# EasyEDA Pro project TM4C123（改）.eprj

# Schematic TM4C核心板
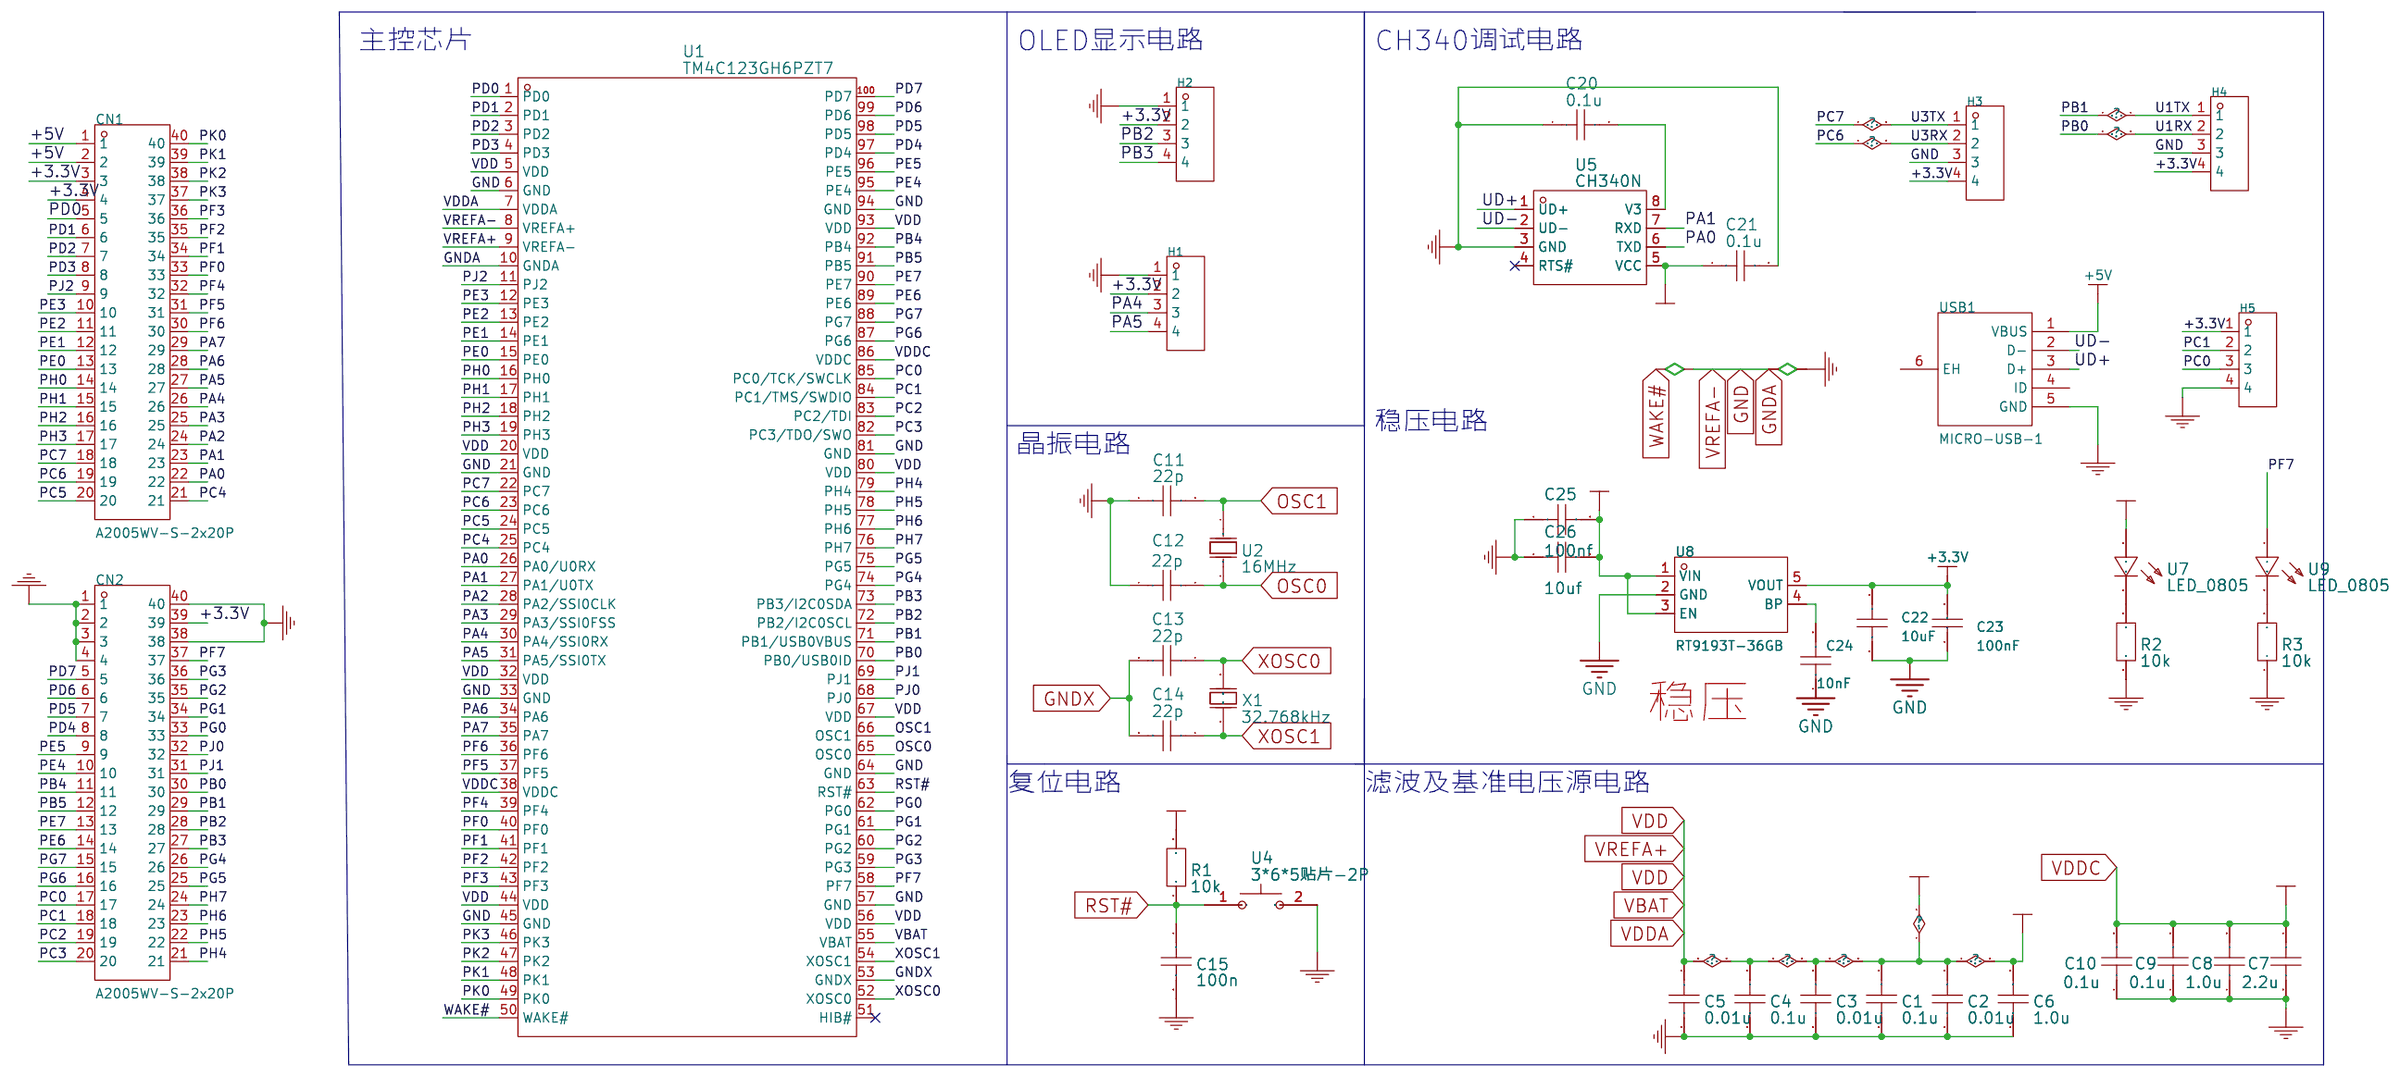
[diagram p0: schematic sheet]

## Parts
C1  0.1u  [C0603]
C2  0.01u  [C0603]
C3  0.01u  [C0603]
C4  0.1u  [C0603]
C5  0.01u  [C0603]
C6  1.0u  [C0603]
C7  2.2u  [C0603]
C8  1.0u  [C0603]
C9  0.1u  [C0603]
C10  0.1u  [C0603]
C11  22p  [C0603]
C12  22p  [C0603]
C13  22p  [C0603]
C14  22p  [C0603]
C15  100n  [C0603]
C20  0.1u  [C0603]
C21  0.1u  [C0603]
C22  10uF  [C0603]
C23  100nF  [C0603]
C24  10nF  [C0603]
C25  100nf  [C0603]
C26  10uf  [C0603]
CN1  A2005WV-S-2x20P  [HDR-TH_40P-P2.54-V-M-R2-C20-S2.54]
CN2  A2005WV-S-2x20P  [HDR-TH_40P-P2.54-V-M-R2-C20-S2.54]
H1  -  [HDR-TH_4P-P2.54-V-F]
H2  -  [HDR-TH_4P-P2.54-V-F]
H3  -  [HDR-TH_4P-P2.54-V-F]
H4  -  [HDR-TH_4P-P2.54-V-F]
H5  -  [HDR-TH_4P-P2.54-V-F]
R1  10k  [R0603]
R2  10k  [R0603]
R3  10k  [R0603]
U1  TM4C123GH6PZT7  [LQFP-100_L14.0-W14.0-P0.50-LS16.0-TL]
U2  16MHz  [CRYSTAL_SMD_5032-2PIN_5.0X3.2MM]
U4  3*6*5贴片-2P  [SW-SMD_L6.0-W3.5-LS8.0]
U5  CH340N  [CH340N]
U7  LED_0805  [LED0603-RD_BLUE]
U8  RT9193T-36GB  [TSOT-23-5_L2.9-W1.6-P0.95-LS2.8-BL]
U9  LED_0805  [LED0603-RD_BLUE]
USB1  MICRO-USB-1  [MICRO-USB-SMD_C9900008946]
X1  32.768kHz  [OSC-SMD_2P-L3.2-W1.5-1]

## Library data of the parts
C1 C4 C9 C10 C20 C21 = 0.1u: link: https://item.szlcsc.com/373011.html; 3DModel: C0805_L2.0-W1.3-H1.3
C2 C3 C5 = 0.01u: link: https://item.szlcsc.com/373011.html; 3DModel: C0805_L2.0-W1.3-H1.3
C6 C8 = 1.0u: link: https://item.szlcsc.com/373011.html; 3DModel: C0805_L2.0-W1.3-H1.3
C7 = 2.2u: link: https://item.szlcsc.com/373011.html; 3DModel: C0805_L2.0-W1.3-H1.3
C11-C14 = 22p: link: https://item.szlcsc.com/373011.html; 3DModel: C0805_L2.0-W1.3-H1.3
C15 = 100n: link: https://item.szlcsc.com/373011.html; 3DModel: C0805_L2.0-W1.3-H1.3
C22 C24 = CL10A106KP8NNNC: 容值:10uF;精度:±10%;额定电压:10V;材质(温度系数):X5R;; LCSC Part Name: 10uF ±10% 10V; Supplier Part: C19702; Manufacturer: SAMSUNG(三星); Supplier Footprint: 0603; JLCPCB Part Class: 基础库; Datasheet: https://atta.szlcsc.com/upload/public/pdf/source/20160103/1457707703378.pdf; Supplier: LCSC; Tolerance: ±10%; Voltage Rated: 10V; Temperature Coefficient: X5R
C23 = 0603B104K500NT: 容值:100nF;精度:±10%;额定电压:50V;材质(温度系数):X7R;; LCSC Part Name: 100nF ±10% 50V; Supplier Part: C30926; Manufacturer: FH(风华); Supplier Footprint: 0603; JLCPCB Part Class: 扩展库; Datasheet: https://atta.szlcsc.com/upload/public/pdf/source/20170923/C30926_1506149436298988724.pdf; Supplier: LCSC; Tolerance: ±10%; Voltage Rated: 50V; Temperature Coefficient: X7R
C25 = 100nf: link: https://item.szlcsc.com/373011.html; 3DModel: C0805_L2.0-W1.3-H1.3
C26 = 10uf: link: https://item.szlcsc.com/373011.html; 3DModel: C0805_L2.0-W1.3-H1.3
CN1 CN2 = A2005WV-S-2x20P: Supplier Part: C9900019710; Supplier Footprint: SMD-40P; JLCPCB Part Class: 扩展库; Supplier: LCSC
H1-H5 = HDR-F_2.54_1x4P: Supplier Part: C2718488; Supplier Footprint: 插件
R1-R3 = 10k: link: https://item.szlcsc.com/142685.html; 3DModel: R0805_L2.0-W1.3-H0.6
U1 = TM4C123GH6PZT7: link: https://atta.szlcsc.comnull; Supplier: LCSC; Supplier Part: C2863116; Manufacturer: TI(德州仪器)
U2 = 16MHz: license: https://www.gnu.org/licenses/lgpl-2.1.html; Supplier: LCSC; Supplier Part: C2450749; Manufacturer: ECS; Manufacturer Part: ECS-160-18-30-JGN-TR; JLCPCB Part Class: Extended Part
U4 = 3*6*5贴片-2P: link: https://item.szlcsc.com/300333.html; 3DModel: SW-SMD_L6.0-W3.5-H5.0-P7.5-LS8.0; Supplier: LCSC; Supplier Part: C9900011307; Manufacturer: null; JLCPCB Part Class: Extended Part
U5 = CH340N: Supplier: LCSC; Supplier Part: C506813; Manufacturer: WCH(Jiangsu Qin Heng); Paste Type: expand
U7 U9 = LED_0805: link: https://atta.szlcsc.com/upload/public/pdf/source/20181204/C264418_73B9BB56B6270D5E5A61DA675CE1A050.pdf; 3DModel: LED0805-R-RD_GREEN; Supplier: LCSC; Supplier Part: C9900014946; Manufacturer: null; JLCPCB Part Class: Extended Part
U8 = RT9193T-36GB: Supplier Part: C2926026; Supplier Footprint: TSOT-23-5; JLCPCB Part Class: 扩展库; Supplier: LCSC
USB1 = MICRO-USB-1: Supplier Part: C9900008946; Supplier Footprint: USB-micro; JLCPCB Part Class: 扩展库; Supplier: LCSC
X1 = 32.768kHz: link: https://atta.szlcsc.com/upload/public/pdf/source/20201023/C909615_5CB83FDF197FE73AFEAD0F20FB1E7116.pdf; Supplier: LCSC; Supplier Part: C130253; Manufacturer: ABRACON; Manufacturer Part: ABS07-32.768KHZ-T; JLCPCB Part Class: Extended Part

## Nets
+3.3V: C1.2 C2.2 C3.2 C4.2 C5.1 C6.2 C22.2 C23.2 CN1.3 CN1.4 CN2.39 H1.2 H2.2 H3.4 H4.4 H5.1 R1.2 U1.5(VDD) U1.7(VDDA) U1.9(VREFA-) U1.20(VDD) U1.32(VDD) U1.44(VDD) U1.55(VBAT) U1.56(VDD) U1.67(VDD) U1.80(VDD) U1.93(VDD) U7.1(A) U8.5(VOUT)
+5V: C21.1 C25.2 C26.2 CN1.1 CN1.2 U5.5(VCC) U8.1(VIN) U8.3(EN) USB1.1(VBUS)
GND: C1.1 C2.1 C3.1 C4.1 C5.2 C6.1 C7.2 C8.1 C9.1 C10.1 C11.1 C12.1 C15.2 C20.1 C21.2 C22.1 C23.1 C24.1 C25.1 C26.1 CN2.1 CN2.2 CN2.3 CN2.4 CN2.38 CN2.40 H1.1 H2.1 H3.3 H4.3 H5.4 R2.1 R3.1 U1.6(GND) U1.8(VREFA+) U1.10(GNDA) U1.21(GND) U1.33(GND) U1.45(GND) U1.50(WAKE#) U1.57(GND) U1.64(GND) U1.81(GND) U1.94(GND) U4.2 U5.3(GND) U8.2(GND) USB1.5(GND)
GNDX: C13.2 C14.2 U1.53(GNDX)
+MCU_VDDC: C7.1 C8.2 C9.2 C10.2 U1.38(VDDC) U1.86(VDDC)
OSC0: C12.2 U1.65(OSC0) U2.2(OSC2)
OSC1: C11.2 U1.66(OSC1) U2.1(OSC1)
PA0: CN1.22 U1.26(PA0/U0RX) U5.6(TXD)
PA1: CN1.23 U1.27(PA1/U0TX) U5.7(RXD)
PA2: CN1.24 U1.28(PA2/SSI0CLK)
PA3: CN1.25 U1.29(PA3/SSI0FSS)
PA4: CN1.26 H1.3 U1.30(PA4/SSI0RX)
PA5: CN1.27 H1.4 U1.31(PA5/SSI0TX)
PA6: CN1.28 U1.34(PA6)
PA7: CN1.29 U1.35(PA7)
PB0: CN2.30 H4.2 U1.70(PB0/USB0ID)
PB1: CN2.29 H4.1 U1.71(PB1/USB0VBUS)
PB2: CN2.28 H2.3 U1.72(PB2/I2C0SCL)
PB3: CN2.27 H2.4 U1.73(PB3/I2C0SDA)
PB4: CN2.11 U1.92(PB4)
PB5: CN2.12 U1.91(PB5)
PC0: CN2.17 H5.3 U1.85(PC0/TCK/SWCLK)
PC1: CN2.18 H5.2 U1.84(PC1/TMS/SWDIO)
PC2: CN2.19 U1.83(PC2/TDI)
PC3: CN2.20 U1.82(PC3/TDO/SWO)
PC4: CN1.21 U1.25(PC4)
PC5: CN1.20 U1.24(PC5)
PC6: CN1.19 H3.2 U1.23(PC6)
PC7: CN1.18 H3.1 U1.22(PC7)
PD0: CN1.5 U1.1(PD0)
PD1: CN1.6 U1.2(PD1)
PD2: CN1.7 U1.3(PD2)
PD3: CN1.8 U1.4(PD3)
PD4: CN2.8 U1.97(PD4)
PD5: CN2.7 U1.98(PD5)
PD6: CN2.6 U1.99(PD6)
PD7: CN2.5 U1.100(PD7)
PE0: CN1.13 U1.15(PE0)
PE1: CN1.12 U1.14(PE1)
PE2: CN1.11 U1.13(PE2)
PE3: CN1.10 U1.12(PE3)
PE4: CN2.10 U1.95(PE4)
PE5: CN2.9 U1.96(PE5)
PE6: CN2.14 U1.89(PE6)
PE7: CN2.13 U1.90(PE7)
PF0: CN1.33 U1.40(PF0)
PF1: CN1.34 U1.41(PF1)
PF2: CN1.35 U1.42(PF2)
PF3: CN1.36 U1.43(PF3)
PF4: CN1.32 U1.39(PF4)
PF5: CN1.31 U1.37(PF5)
PF6: CN1.30 U1.36(PF6)
PF7: CN2.37 U1.58(PF7) U9.1(A)
PG0: CN2.33 U1.62(PG0)
PG1: CN2.34 U1.61(PG1)
PG2: CN2.35 U1.60(PG2)
PG3: CN2.36 U1.59(PG3)
PG4: CN2.26 U1.74(PG4)
PG5: CN2.25 U1.75(PG5)
PG6: CN2.16 U1.87(PG6)
PG7: CN2.15 U1.88(PG7)
PH0: CN1.14 U1.16(PH0)
PH1: CN1.15 U1.17(PH1)
PH2: CN1.16 U1.18(PH2)
PH3: CN1.17 U1.19(PH3)
PH4: CN2.21 U1.79(PH4)
PH5: CN2.22 U1.78(PH5)
PH6: CN2.23 U1.77(PH6)
PH7: CN2.24 U1.76(PH7)
PJ0: CN2.32 U1.68(PJ0)
PJ1: CN2.31 U1.69(PJ1)
PJ2: CN1.9 U1.11(PJ2)
PK0: CN1.40 U1.49(PK0)
PK1: CN1.39 U1.48(PK1)
PK2: CN1.38 U1.47(PK2)
PK3: CN1.37 U1.46(PK3)
RST#: C15.1 R1.1 U1.63(RST#) U4.1
UD+: U5.1(UD+) USB1.3(D+)
UD-: U5.2(UD-) USB1.2(D-)
XOSC0: C13.1 U1.52(XOSC0) X1.2(OSC2)
XOSC1: C14.1 U1.54(XOSC1) X1.1(OSC1)
$1N922: C20.2 U5.8(V3)
$1N1167: R2.2 U7.2(C)
$1N2381: C24.2 U8.4(BP)
$1N8327: R3.2 U9.2(C)

Not connected (* = marked no-connect by the designer): U1 51(HIB#)*; U5 4(RTS#)*; USB1 4(ID) 6(EH)

## Notes on the sheet
- 主控芯片
- OLED显示电路
- CH340调试电路
- 稳压电路
- 晶振电路
- 稳压
- 复位电路
- 滤波及基准电压源电路

# Board PCB_PCB_TM4C核心板-copy_2024-06-06
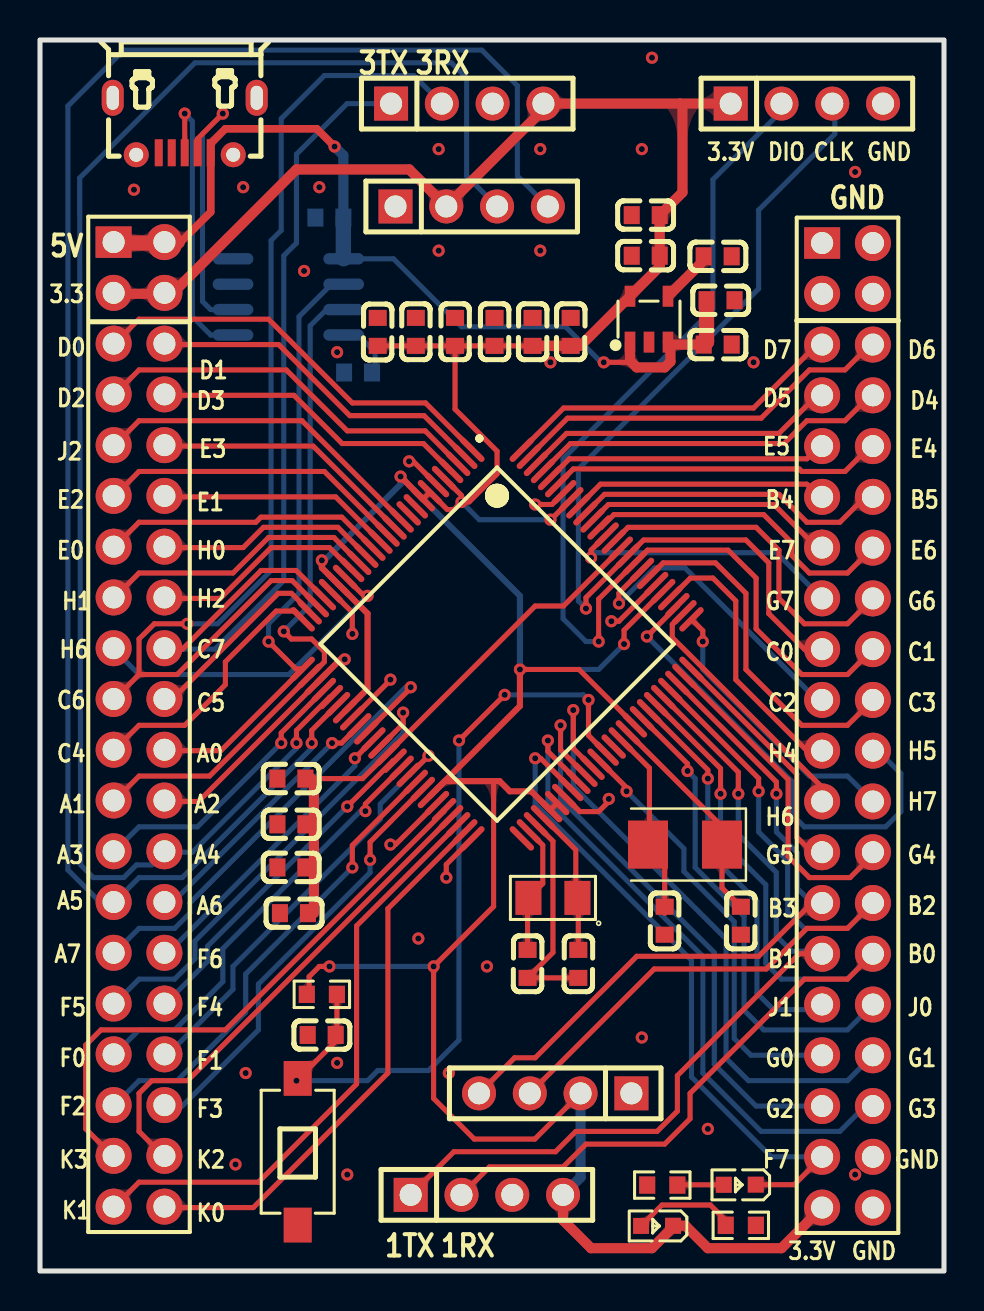
[diagram p1: board, top side]
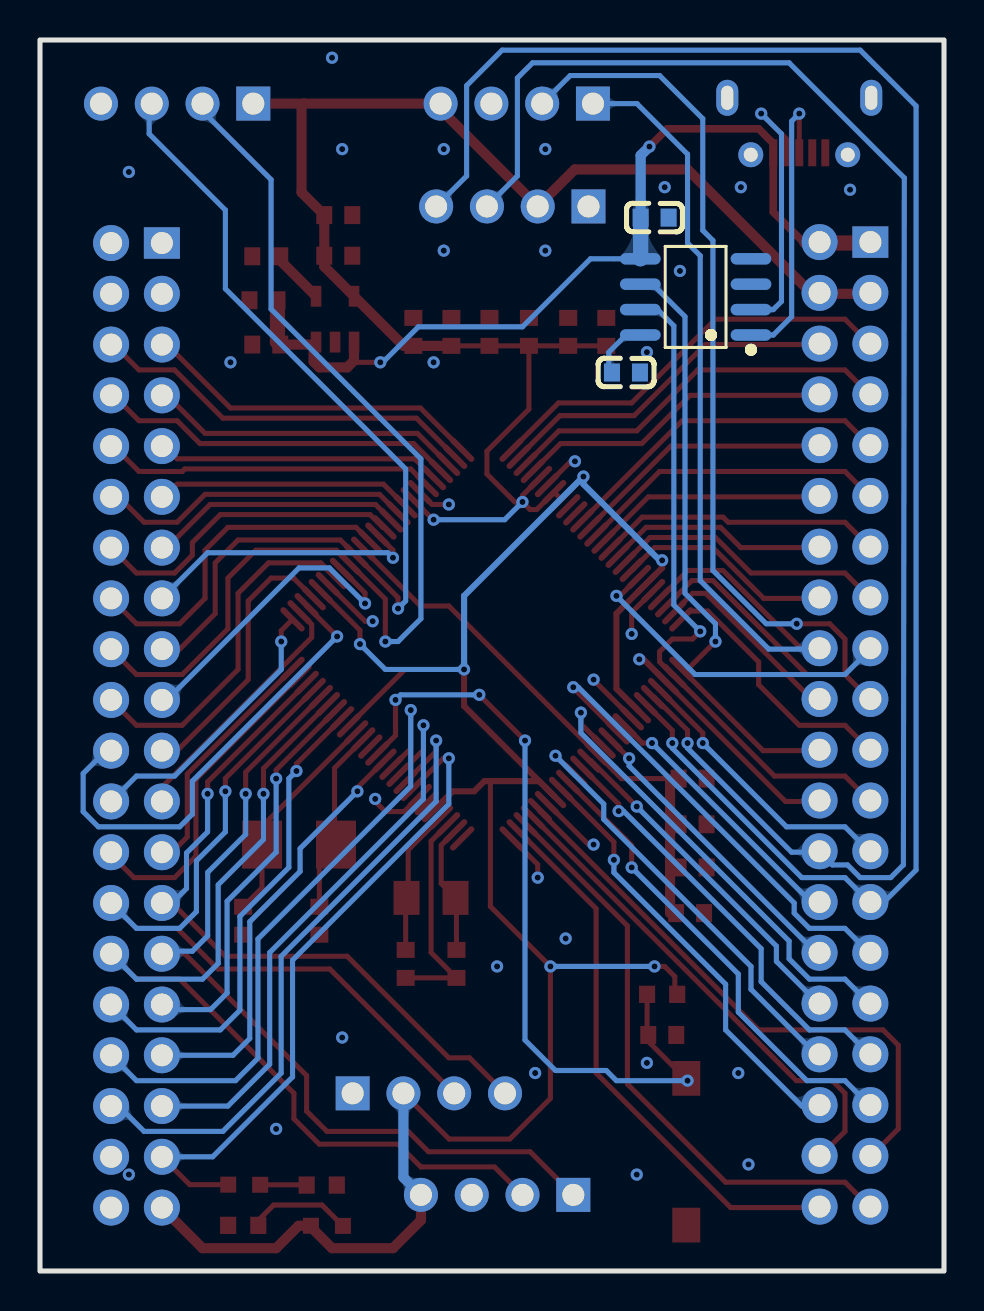
[diagram p2: board, bottom side, seen from below]

Outline 45.21 x 61.6 mm; copper layers: Top Layer, Bottom Layer. Coordinates in mm from the lower left corner of the outline.
Outline path: rectangle 0,61.6 45.21,0
Stack: Top Layer 0.035mm / Dielectric1 1.51mm FR4 er 4.5 / Bottom Layer 0.035mm

## Design rules (mm)
template: 用户自定义配置
spacing Default (default): track to track 0.127, other pairs 0 to 0.152
track width Default (default): min 0.254, default 0.254, max 25.4
differential pair differentialPair (default): width min 0.127, default 0.254, max 2.54; gap min 0.152, default 0.152
via Default (default): diameter min 0.61, default 0.61, max 100.025; hole min 0.305, default 0.305, max 59.995
net GND uses gge34936

## Placement (name value [footprint] x y rotation side)
C1  0.1u  [C0603]  22.73 46.99 270 top
C2  0.01u  [C0603]  24.64 46.99 270 top
C3  0.01u  [C0603]  20.76 46.99 270 top
C4  0.1u  [C0603]  18.8 46.99 270 top
C5  0.01u  [C0603]  16.89 46.99 90 top
C6  1.0u  [C0603]  26.54 46.99 270 top
C7  2.2u  [C0603]  12.7 17.91 180 top
C8  1.0u  [C0603]  12.57 20.19 0 top
C9  0.1u  [C0603]  12.57 22.35 0 top
C10  0.1u  [C0603]  12.57 24.64 0 top
C11  22p  [C0603]  35.05 17.53 90 top
C12  22p  [C0603]  31.24 17.53 90 top
C13  22p  [C0603]  24.38 15.37 270 top
C14  22p  [C0603]  26.92 15.37 270 top
C15  100n  [C0603]  14.09 11.81 180 top
C20  0.1u  [C0603]  15.91 44.96 0 bottom
C21  0.1u  [C0603]  14.47 52.71 180 bottom
C22  10uF  [C0603]  30.29 50.8 0 top
C23  100nF  [C0603]  30.29 52.83 0 top
C24  10nF  [C0603]  33.89 50.77 180 top
C25  100nf  [C0603]  34.04 48.57 180 top
C26  10uf  [C0603]  33.89 46.36 180 top
CN1  A2005WV-S-2x20P  [HDR-TH_40P-P2.54-V-M-R2-C20-S2.54]  4.95 27.35 270 top
CN2  A2005WV-S-2x20P  [HDR-TH_40P-P2.54-V-M-R2-C20-S2.54]  40.39 27.31 270 top
H1  -  [HDR-TH_4P-P2.54-V-F]  21.59 53.27 0 top
H2  -  [HDR-TH_4P-P2.54-V-F]  25.77 8.89 180 top
H3  -  [HDR-TH_4P-P2.54-V-F]  21.37 58.41 0 top
H4  -  [HDR-TH_4P-P2.54-V-F]  22.35 3.81 0 top
H5  -  [HDR-TH_4P-P2.54-V-F]  38.35 58.41 0 top
R1  10k  [R0603]  14.1 13.84 180 top
R2  10k  [R0603]  35.05 2.29 180 top
R3  10k  [R0603]  31.12 4.3 0 top
U1  TM4C123GH6PZT7  [LQFP-100_L14.0-W14.0-P0.50-LS16.0-TL]  22.86 31.37 315 top
U2  16MHz  [CRYSTAL_SMD_5032-2PIN_5.0X3.2MM]  32.26 21.34 180 top
U4  3*6*5贴片-2P  [SW-SMD_L6.0-W3.5-LS8.0]  12.89 5.97 270 top
U5  -  [CH340N]  10.29 50.52 90 bottom
U7  LED_0805  [LED0603-RD_BLUE]  30.86 2.26 180 top
U8  RT9193T-36GB  [TSOT-23-5_L2.9-W1.6-P0.95-LS2.8-BL]  30.46 47.62 0 top
U9  LED_0805  [LED0603-RD_BLUE]  35 4.32 180 top
USB1  MICRO-USB-1  [MICRO-USB-SMD_C9900008946]  7.24 57.28 180 top
X1  32.768kHz  [OSC-SMD_2P-L3.2-W1.5-1]  25.65 18.67 180 top

## Footprints (pads in the part's own frame, mm; a bottom-side part is the same pattern mirrored in y, then rotated)
C0603
  rect 0.8x0.9 smd: 1(-0.7,0) 2(0.7,0)
CH340N
  oval 0.574x2.035 smd: 1(-3.683,-0.633) 2(-2.413,-0.633) 3(-1.143,-0.633) 4(0.128,-0.633) 5(0.128,4.902) 6(-1.143,4.902) 7(-2.413,4.902) 8(-3.683,4.902)
CRYSTAL_SMD_5032-2PIN_5.0X3.2MM
  rect 2x2.4 smd: 1(-1.85,0) 2(1.85,0)
HDR-TH_4P-P2.54-V-F
  rect 1.7x1.7 hole 1.1: 1(-3.81,0)
  round 1.7 hole 1.1: 2(-1.27,0) 3(1.27,0) 4(3.81,0)
HDR-TH_40P-P2.54-V-M-R2-C20-S2.54
  rect 1.575x1.8 hole 1.1: 1(-24.13,-1.27)
  round 1.8 hole 1.1: 2(-24.13,1.27) 3(-21.59,-1.27) 4(-21.59,1.27) 5(-19.05,-1.27) 6(-19.05,1.27) 7(-16.51,-1.27) 8(-16.51,1.27) 9(-13.97,-1.27) 10(-13.97,1.27) 11(-11.43,-1.27) 12(-11.43,1.27) 13(-8.89,-1.27) 14(-8.89,1.27) 15(-6.35,-1.27) 16(-6.35,1.27) 17(-3.81,-1.27) 18(-3.81,1.27) 19(-1.27,-1.27) 20(-1.27,1.27) 21(1.27,-1.27) 22(1.27,1.27) 23(3.81,-1.27) 24(3.81,1.27) 25(6.35,-1.27) 26(6.35,1.27) 27(8.89,-1.27) 28(8.89,1.27) 29(11.43,-1.27) 30(11.43,1.27) 31(13.97,-1.27) 32(13.97,1.27) 33(16.51,-1.27) 34(16.51,1.27) 35(19.05,-1.27) 36(19.05,1.27) 37(21.59,-1.27) 38(21.59,1.27) 39(24.13,-1.27) 40(24.13,1.27)
LED0603-RD_BLUE
  rect 0.8x0.8 smd: 1(-0.799,-0.004) 2(0.799,0.004)
LQFP-100_L14.0-W14.0-P0.50-LS16.0-TL
  oval 1.6x0.3 smd: 1(-7.75,6) 2(-7.75,5.5) 3(-7.75,5) 4(-7.75,4.5) 5(-7.75,4) 6(-7.75,3.5) 7(-7.75,3) 8(-7.75,2.501) 9(-7.75,2) 10(-7.75,1.5) 11(-7.75,1) 12(-7.75,0.5) 13(-7.75,0) 14(-7.75,-0.5) 15(-7.75,-1) 16(-7.75,-1.5) 17(-7.75,-2) 18(-7.75,-2.501) 19(-7.75,-3) 20(-7.75,-3.5) 21(-7.75,-4) 22(-7.75,-4.5) 23(-7.75,-5) 24(-7.75,-5.5) 25(-7.75,-6) 51(7.75,-6) 52(7.75,-5.5) 53(7.75,-5) 54(7.75,-4.5) 55(7.75,-4) 56(7.75,-3.5) 57(7.75,-3) 58(7.75,-2.501) 59(7.75,-2) 60(7.75,-1.5) 61(7.75,-1) 62(7.75,-0.5) 63(7.75,0) 64(7.75,0.5) 65(7.75,1) 66(7.75,1.5) 67(7.75,2) 68(7.75,2.5) 69(7.75,3) 70(7.75,3.5) 71(7.75,4) 72(7.75,4.5) 73(7.75,5) 74(7.75,5.5) 75(7.75,6)
  oval 0.3x1.6 smd: 26(-6,-7.75) 27(-5.5,-7.75) 28(-5,-7.75) 29(-4.5,-7.75) 30(-4,-7.75) 31(-3.5,-7.75) 32(-3,-7.75) 33(-2.5,-7.75) 34(-2,-7.75) 35(-1.5,-7.75) 36(-1,-7.75) 37(-0.5,-7.75) 38(0,-7.75) 39(0.5,-7.75) 40(1,-7.75) 41(1.5,-7.75) 42(2,-7.75) 43(2.501,-7.75) 44(3,-7.75) 45(3.5,-7.75) 46(4,-7.75) 47(4.5,-7.75) 48(5,-7.75) 49(5.5,-7.75) 50(6,-7.75) 76(6,7.75) 77(5.5,7.75) 78(5,7.75) 79(4.5,7.75) 80(4,7.75) 81(3.5,7.75) 82(3,7.75) 83(2.501,7.75) 84(2,7.75) 85(1.5,7.75) 86(1,7.75) 87(0.5,7.75) 88(0,7.75) 89(-0.5,7.75) 90(-1,7.75) 91(-1.5,7.75) 92(-2,7.75) 93(-2.501,7.75) 94(-3,7.75) 95(-3.5,7.75) 96(-4,7.75) 97(-4.5,7.75) 98(-5,7.75) 99(-5.5,7.75) 100(-6,7.75)
MICRO-USB-SMD_C9900008946
  rect 0.4x1.35 smd: 1(-1.3,1.325) 2(-0.65,1.325) 3(0,1.325) 4(0.65,1.325) 5(1.3,1.325)
  oval 1.1x1.8 hole 0.6x1.2: 6(-3.6,-1.425) 6(3.6,-1.425)
  round 1.25 hole 0.7: 6(-2.425,1.425) 6(2.425,1.425)
OSC-SMD_2P-L3.2-W1.5-1
  rect 1.3x1.7 smd: 1(-1.225,0) 2(1.225,0)
R0603
  rect 0.806x0.864 smd: 1(-0.753,0) 2(0.753,0)
SW-SMD_L6.0-W3.5-LS8.0
  rect 1.74x1.4 smd: 1(-3.67,0) 2(3.67,0)
TSOT-23-5_L2.9-W1.6-P0.95-LS2.8-BL
  rect 0.532x1.045 smd: 1(-0.95,-1.147) 2(0,-1.147) 3(0.95,-1.147) 4(0.95,1.147) 5(-0.95,1.147)

## Nets
As in the schematic, except:
+3.3V: C1.2 C2.2 C3.2 C4.2 C5.1 C6.2 C22.2 C23.2 CN1.3 CN1.4 CN2.39 H1.2 H2.2 H3.4 H4.4 H5.1 R1.2 U1.5 U1.7 U1.8 U1.20 U1.32 U1.44 U1.55 U1.56 U1.67 U1.80 U1.93 U7.1 U8.5
GND: C1.1 C2.1 C3.1 C4.1 C5.2 C6.1 C7.2 C8.1 C9.1 C10.1 C11.1 C12.1 C15.2 C20.1 C21.2 C22.1 C23.1 C24.1 C25.1 C26.1 CN2.1 CN2.2 CN2.3 CN2.4 CN2.38 CN2.40 H1.1 H2.1 H3.3 H4.3 H5.4 R2.1 R3.1 U1.6 U1.9 U1.10 U1.21 U1.33 U1.45 U1.50 U1.57 U1.64 U1.81 U1.94 U4.2 U5.3 U8.2 USB1.5
VDDC: C7.1 C8.2 C9.2 C10.2 U1.38 U1.86

Pads without a net: U1 51; U5 4; USB1 4 6

## Via types
v1: diameter 0.61, hole 0.306, Top Layer to Bottom Layer, 22 vias
v2: diameter 0.61, hole 0.305, Top Layer to Bottom Layer, 60 vias

## Routing (per net, layer and track width the routed paths; a pad name or vN(x,y) marks a point on that pad's centre or on a via; arc(x,y) is an arc through that point)
+3.3V: length 197
  Top Layer w0.254: v2(21.08,38.48) 21.46,38.48 22.86,39.88 22.86,41.02 20.76,43.12 C3.2 ; v2(21.08,38.48) 20.7,38.1 20.37,38.1 U1.7 19.15,38.62 ; v2(21.08,38.48) 21.08,38.8 U1.5 ; C3.2 C4.2 C5.1 ; C3.2 C1.2 C2.2 ; v2(24,30.1) 26.96,30.1 29.75,27.3 ; v2(25.53,37.59) 25.55,37.59 26.57,38.62 ; R1.2 13.46,13.96 13.46,14.73 13.97,15.24 v2(14.48,15.24) ; U1.80 29.21,32.06 v2(29.21,31.37) ; 22.69,24.51 22.69,18.24 v2(19.69,15.24) 19.69,8.64 21.72,6.6 24.75,6.6 H2.2 ; 25.87,23.41 25.51,23.06
  Top Layer w0.305: 19.15,38.62 v2(18.03,39.75) ; 25.51,23.06 24.57,24 23.5,24 22.99,24.51 20.24,24.51 U1.44 24,28.27 v2(24,30.1) ; v2(14.1,35.56) 14.1,35.18 16.38,32.9 16.38,29.13 15.26,28.01
  Top Layer w0.508: 3.68,48.9 6.6,48.9 12.83,55.12 18.47,55.12 20.32,53.27 25.18,58.12 H3.4 32,58.41 ; CN2.39 37.08,1.14 33.4,1.14 32.28,2.26 U7.1 31.66,2.2 30.61,1.14 27.56,1.14 26.16,2.54 H4.4 ; 32,58.41 H5.1 ; 32,58.41 32.13,58.28 32.13,53.97 C23.2 C22.2 30.99,50.26 U8.5 27.02,46.29 C6.2 C2.2
  Bottom Layer w0.254: v2(21.08,38.48) 21.97,37.59 v2(25.53,37.59) ; v2(14.48,15.24) v2(19.69,15.24) ; v2(29.21,31.37) 27.94,30.1 v2(24,30.1)
  Bottom Layer w0.305: v2(24,30.1) 24,33.78 v2(18.03,39.75) 18.03,39.37 14.22,35.56 v2(14.1,35.56)
  Bottom Layer w0.508: H4.4 27.04,4.69 H2.2
+5V: length 46.3
  Top Layer w0.254: v2(28.19,45.47) 29.42,45.47 29.51,45.55
  Top Layer w0.381: v2(14.73,56.26) 13.84,57.15 9.27,57.15 8.54,56.42 8.54,52.99 6.99,51.44
  Top Layer w0.508: U8.1 29.51,45.55 29.84,45.21 31.24,45.21 31.53,45.5 31.53,46.36 ; 6.22,51.44 6.99,51.44 ; C26.2 31.53,46.36 ; 31.53,46.36 U8.3
  Top Layer w0.762: C26.2 33.34,46.5 C25.2 ; 3.68,51.44 6.22,51.44
  Bottom Layer w0.254: v2(28.19,45.47) 28.07,45.47 26.29,47.24 21.08,47.24 17.68,50.64 U5.5
  Bottom Layer w0.508: v2(14.73,56.26) 15.17,55.82 C21.1
  Bottom Layer w0.762: C21.1 15.17,50.66 U5.5
GND: length 20.7
  Top Layer w0.254: 18.29,40.51 18.67,40.51 19.86,39.32 ; v2(15.62,31.88) 15.62,32.95 U1.21 ; 15.61,27.66 17.53,29.57 v2(17.53,29.59) ; 19.86,23.41 17.78,21.34 v2(17.53,21.34) ; 30.82,34.37 28.95,32.51 v2(28.58,32.51) ; v2(20.32,19.69) 20.32,20.34 U1.50 ; v2(24.77,38.35) 25.6,38.35 26.22,38.97 ; 26.22,23.77 27,22.99 27.94,22.99 28.45,23.5 v2(28.45,23.62)
  vias: v1(4.7,54.1) v1(9.78,5.33) v1(10.16,54.23) v1(10.29,9.91) v1(13.21,50.04) v1(13.97,54.23) v1(14.86,45.97) v1(14.86,10.41) v1(15.37,4.83) v1(19.94,56.13) v1(19.94,51.05) v1(20.45,9.91) v1(25.02,56.13) v1(25.02,51.05) v1(25.53,45.47) v1(30.1,56.13) v1(30.1,11.68) v1(30.61,60.71) v1(33.4,7.11) v1(35.69,45.47) v1(40.77,54.99) v1(40.77,4.83) v2(18.46,40.51) v2(18.92,16.64) v2(22.35,15.24)
GNDX: length 11.1
  Top Layer w0.254: U1.53 25.65,21.5 25.65,15.94 C13.2 C14.2
VDDC: length 27
  Top Layer w0.254: 13.57,24.64 16.13,24.64 24.77,33.27 26.18,33.27 U1.86
  Top Layer w0.508: 13.57,24.64 13.7,24.51 13.7,17.91
OSC0: length 9.6
  Top Layer w0.254: U1.65 30.48,25.16 30.48,21.26 31.24,20.5 31.24,17.89
OSC1: length 11.1
  Top Layer w0.254: C11.2 34.11,19.17 U2.1 34.11,22.24 U1.66
PA0: length 30.7
  Top Layer w0.254: 13.14,30.13 12.79,30.13 v2(11.43,31.5) ; 13.14,30.12 9.05,26.04 6.22,26.04
  Bottom Layer w0.254: U5.6 14.58,49.37 12.95,47.75 12.95,33.91 11.43,32.39 v2(11.43,31.5)
PA1: length 34.3
  Top Layer w0.254: v2(12.19,32) 12.57,31.62 13.59,31.62 14.22,30.99 14.22,30.48 13.52,29.78 13.49,29.78 8.48,24.77 4.95,24.77 3.68,23.5
  Bottom Layer w0.254: U5.7 15.16,48.13 14.35,48.13 13.51,47.29 13.51,33.32 v2(12.19,32)
PA2: length 12
  Top Layer w0.254: 13.85,29.41 7.93,23.5 6.22,23.5
  Top Layer w0.305: v2(15.24,30.61) 15.03,30.61 13.85,29.42
PA3: length 14.2
  Top Layer w0.254: v2(12.07,26.42) 12.07,26.92 14.2,29.07
  Bottom Layer w0.254: v2(12.07,26.42) 7.87,22.23 4.95,22.23 3.68,20.96
PA4: length 80.5
  Top Layer w0.254: U1.30 14.49,28.72 12.83,27.05 v2(12.83,26.42)
  Bottom Layer w0.254: v2(12.83,26.42) 12.83,26.16 7.62,20.96 6.22,20.96 5.59,20.32 4.83,20.32 4.19,19.69 2.67,19.69 2.03,20.32 1.99,54.69 7.75,60.45 20.57,60.45 21.34,59.69 21.34,54.79 H1.3
PA5: length 88.1
  Top Layer w0.254: 14.9,28.36 13.59,27.05 v2(13.59,26.42)
  Bottom Layer w0.254: v2(13.59,26.42) 13.59,26.16 7.11,19.69 4.95,19.69 3.68,18.42 3.05,18.42 1.4,20.07 1.4,58.29 4.19,61.09 22.1,61.09 23.88,59.31 23.88,54.79 H1.4
PA6: length 13
  Top Layer w0.254: v2(14.61,26.42) 15.08,26.42 15.97,27.3
  Bottom Layer w0.254: v2(14.61,26.42) 6.6,18.42
PA7: length 23.9
  Top Layer w0.254: v2(18.54,29.21) 18.54,29.17 U1.35
  Bottom Layer w0.254: v2(18.54,29.21) 18.29,29.21 7.49,18.42 7.49,17.91 6.73,17.15 4.95,17.15 3.68,15.88
PB0: length 47.8
  Top Layer w0.254: CN2.30 40.39,14.61 38.23,14.61 32.51,8.89 32.51,7.62 31.24,6.35 27.31,6.35 26.16,5.21 22.48,5.21 21.08,3.81 H4.2 ; 30.82,28.36 34.04,25.14 v2(34.04,23.88)
  Bottom Layer w0.254: CN2.30 40.39,14.61 37.08,14.61 36.3,15.39 36.3,19.33 34.04,21.59 v2(34.04,23.88)
PB1: length 43.6
  Top Layer w0.254: H4.1 20.7,5.97 25.78,5.97 26.8,6.98 30.86,6.98 31.88,8 31.88,9.78 37.97,15.88 CN2.29 ; U1.71 34.93,24.96 v2(34.93,23.88)
  Bottom Layer w0.254: CN2.29 38.99,16 37.59,16 36.83,16.77 36.83,19.94 34.93,21.84 v2(34.93,23.88)
PB2: length 39.8
  Top Layer w0.254: v2(35.94,24) 35.94,24.65 31.52,29.07 ; CN2.28 40.39,17.15 38.35,17.15 36.32,15.11 30.72,15.11 H2.3
  Bottom Layer w0.254: v2(35.94,24) 35.94,21.97 37.39,20.52 37.39,17.98 38.23,17.15 40.39,17.15 CN2.28
PB3: length 34.9
  Top Layer w0.254: CN2.27 38.61,18.42 35.94,15.75 29.84,15.75 24.77,10.67 23.73,10.67 H2.4 ; v2(36.83,23.88) 36.83,24.47 31.87,29.42
  Bottom Layer w0.254: 38.61,18.42 37.88,19.14 37.88,20.92 36.83,21.97 v2(36.83,23.88)
PB4: length 12.8
  Top Layer w0.254: 26.93,38.26 28.03,39.37 38.35,39.37 38.99,38.73
PB5: length 15.1
  Top Layer w0.254: U1.91 28.23,38.86 36.96,38.86 38.35,37.47 40.01,37.47 41.02,38.48
PC0: length 47.9
  Top Layer w0.254: CN2.17 38.23,31.12 36.45,32.89 36.45,35.43 35.31,36.58 30.19,36.58 U1.85 27.31,33.69 v2(27.31,33.15)
  Bottom Layer w0.254: v2(27.31,33.15) 26.92,33.53 26.92,40.13 35.94,49.15 35.94,53.09 39.75,56.9 39.75,58.28
PC1: length 53.9
  Top Layer w0.254: CN2.18 40.39,29.85 38.1,29.85 35.81,32.13 35.81,34.67 34.42,36.07 30.39,36.07 29.75,35.44 27.94,33.62 v2(27.94,31.5)
  Bottom Layer w0.254: 37.21,58.28 37.21,58.17 33.66,54.61 33.66,48.13 26.16,40.64 26.16,32.64 27.31,31.5 v2(27.94,31.5)
PC2: length 15.5
  Top Layer w0.254: U1.83 28.96,33.93 v2(28.96,33.4)
  Bottom Layer w0.254: 38.86,28.58 32.26,35.18 30.73,35.18 v2(28.96,33.4)
PC3: length 17.6
  Top Layer w0.254: U1.82 31.17,35.43 33.78,35.43 35.31,33.91 35.31,30.1 38.1,27.31 40.39,27.31 CN2.20
PC4: length 13.2
  Top Layer w0.254: 3.68,26.04 4.95,27.31 7.24,27.31 9.27,29.34 9.27,30.48 11.81,33.02 12.72,33.02 13.14,32.61
PC5: length 9.9
  Top Layer w0.254: 6.22,28.58 6.58,28.58 11.92,33.91 12.57,33.91 13.49,32.99
PC6: length 55.3
  Top Layer w0.254: 4.95,29.85 6.86,29.85 11.56,34.54 12.61,34.54 13.85,33.31 ; 4.95,29.85 4.94,29.85 ; 4.95,29.85 3.68,28.58 ; 4.95,29.85 4.95,31.62 5.72,32.39 v2(7.37,32.39)
  Bottom Layer w0.254: v2(7.37,32.39) 8.89,32.39 11.56,35.05 11.56,51.56 12.07,52.07 12.07,57.66 14.22,59.82 18.69,59.82 H3.2
PC7: length 44.9
  Top Layer w0.254: 6.22,31.12 7.12,31.12 11.06,35.05 12.81,35.05 14.2,33.67
  Bottom Layer w0.254: H3.1 15.36,58.41 12.83,55.88 12.83,51.44 12.19,50.8 12.19,34.54 8.76,31.12 6.22,31.12
PD0: length 21.2
  Top Layer w0.254: 3.68,46.36 4.95,47.62 11.43,47.62 15.62,43.43 19.28,43.43 U1.1
PD1: length 17.4
  Top Layer w0.254: 21.27,40.74 19.21,42.8 15.49,42.8 11.94,46.36 6.22,46.36
PD2: length 19.7
  Top Layer w0.254: U1.3 19.26,42.04 15.37,42.04 12.32,45.09 4.95,45.09 3.68,43.82
PD3: length 15.9
  Top Layer w0.254: 6.22,43.82 12.7,43.82 15.11,41.4 19.18,41.4 20.55,40.03 U1.4
PD4: length 17.6
  Top Layer w0.254: U1.97 26.53,41.4 37.21,41.4 38.35,42.55 40.26,42.55 41.12,43.41 41.4,43.41
PD5: length 15.6
  Top Layer w0.254: 38.99,43.82 38.86,43.82 36.96,41.91 26.33,41.91 24.81,40.38
PD6: length 19.4
  Top Layer w0.254: 41.53,46.36 40.26,45.09 38.48,45.09 36.07,42.67 26.38,42.67 24.45,40.74
PD7: length 17.1
  Top Layer w0.254: 24.1,41.09 26.19,43.18 35.69,43.18 38.86,46.36 38.99,46.36
PE0: length 14.3
  Top Layer w0.254: U1.15 15.1,37.72 11.05,37.72 10.8,37.47 4.95,37.47 3.68,36.2
PE1: length 11.7
  Top Layer w0.254: 6.22,38.73 14.79,38.73 U1.14
PE2: length 15.5
  Top Layer w0.254: U1.13 14.22,40.01 4.95,40.01 3.68,38.73
PE3: length 13.2
  Top Layer w0.254: U1.12 13.66,41.28 6.22,41.28
PE4: length 16.6
  Top Layer w0.254: 25.87,39.32 26.67,40.13 37.97,40.13 38.1,40.01 40.26,40.01 41.53,41.28
PE5: length 14.1
  Top Layer w0.254: 38.99,41.28 38.35,40.64 26.47,40.64 U1.96
PE6: length 16
  Top Layer w0.254: CN2.14 40.39,34.93 38.48,34.93 37.59,35.81 37.59,36.45 36.2,37.85 28.7,37.85 28.06,37.2 27.99,37.2
PE7: length 12.6
  Top Layer w0.254: U1.90 28.43,38.35 36.7,38.35 38.86,36.2 38.99,36.2
PF0: length 21.7
  Top Layer w0.254: 16.27,22.86 16.27,23.37 U1.40
  Bottom Layer w0.254: v2(16.27,23.01) 16.03,23.01 9.14,16.13 9.14,14.48 6.73,12.07 4.95,12.07 3.68,10.8
PF1: length 21.9
  Top Layer w0.254: U1.41 18.48,24.83 v2(19.43,25.78)
  Bottom Layer w0.254: 6.22,10.8 6.35,10.8 9.65,14.1 9.65,15.24 17.02,22.61 17.02,23.37 v2(19.43,25.78)
PF2: length 23.6
  Top Layer w0.254: v2(15.62,20.19) 15.62,21.3 18.79,24.48
  Bottom Layer w0.254: 3.68,8.26 4.95,9.53 6.86,9.53 10.29,12.95 10.29,14.86 v2(15.62,20.19)
PF3: length 21.7
  Top Layer w0.254: 19.15,24.12 16.51,21.46 v2(16.51,20.57)
  Bottom Layer w0.254: v2(16.51,20.57) 16.51,19.94 10.92,14.35 10.92,12.07 7.11,8.26 6.22,8.26
PF4: length 17
  Top Layer w0.254: 17.73,25.53 17.66,25.53 v2(15.37,23.24)
  Bottom Layer w0.254: 6.22,13.34 8.38,15.49 8.38,16.26 v2(15.37,23.24)
PF5: length 23.8
  Top Layer w0.254: 17.03,26.24 18.16,27.38 v2(18.16,27.94)
  Bottom Layer w0.254: v2(18.16,27.94) 18.16,26.92 7.75,16.51 7.75,15.62 6.73,14.61 4.95,14.61 3.68,13.34
PF6: length 15.1
  Top Layer w0.254: U1.36 v2(15.75,25.65)
  Bottom Layer w0.254: v2(15.75,25.65) 15.75,25.27 6.35,15.88 6.22,15.88
PF7: length 33.7
  Top Layer w0.254: 26.57,24.12 25.04,25.65 v2(24.77,25.65) ; U9.1 37.72,4.32 CN2.37
  Bottom Layer w0.254: v2(24.77,25.65) 24.77,23.37 32.58,15.55 32.58,9.71 36.58,5.72 CN2.37
PG0: length 21.4
  Top Layer w0.254: v2(29.34,24) 29.34,24.19 27.99,25.53
  Bottom Layer w0.254: v2(29.34,24) 32.2,21.14 32.2,19.99 34.72,17.48 34.72,11.64 35.56,10.8 CN2.33
PG1: length 32.2
  Top Layer w0.254: v2(26.67,28.07) 26.67,26.14 U1.61
  Bottom Layer w0.254: v2(26.67,28.07) 26.67,24.26 34.31,16.62 34.31,10.65 35.43,9.53 40.39,9.53 CN2.34
PG2: length 29.4
  Top Layer w0.254: U1.60 26.04,26.07 v2(26.04,27.31)
  Bottom Layer w0.254: v2(26.04,27.31) 26.04,23.62 33.72,15.93 ; 33.72,15.93 33.72,10.35 35.81,8.26 CN2.35
PG3: length 32.8
  Top Layer w0.254: v2(25.4,26.54) 25.4,26 26.93,24.48
  Bottom Layer w0.254: CN2.36 41.28,8.26 40.01,6.98 36.07,6.98 33.15,9.9 33.15,15.74 25.4,23.5 v2(25.4,26.54)
PG4: length 16.5
  Top Layer w0.254: U1.74 37.41,24.59 37.41,20.75 38.48,19.69 40.51,19.69 41.66,20.83 CN2.26
PG5: length 11.7
  Top Layer w0.254: 38.61,20.96 37.85,21.72 37.85,24.87 32.58,30.13
PG6: length 17.2
  Top Layer w0.254: CN2.16 40.39,32.39 38.23,32.39 36.96,33.66 36.96,36.07 35.81,37.21 29.41,37.21 28.69,36.49
PG7: length 14.1
  Top Layer w0.254: v2(27.56,35.69) 27.56,36.07 U1.88
  Bottom Layer w0.254: CN2.15 36.83,35.94 27.81,35.94 v2(27.56,35.69)
PH0: length 11.1
  Top Layer w0.254: U1.16 14.9,37.21 11.18,37.21 10.16,36.2 6.22,36.2
PH1: length 14.1
  Top Layer w0.254: U1.17 14.7,36.7 11.43,36.7 9.65,34.93 4.95,34.93 3.68,33.66
PH2: length 10.9
  Top Layer w0.254: 6.22,33.66 9.02,33.66 11.56,36.2 14.48,36.2 15.59,35.08 15.61,35.08
PH3: length 16.4
  Top Layer w0.254: v2(16.38,33.78) 16.21,33.78 15.26,34.73
  Bottom Layer w0.254: v2(16.38,33.78) 12.45,29.85 4.95,29.85 3.68,31.12
PH4: length 13.9
  Top Layer w0.254: CN2.21 38.35,26.04 34.8,29.59 34.8,33.53 33.66,34.67 32.53,34.67 31.52,33.67
PH5: length 23.9
  Top Layer w0.254: 31.87,33.31 31.87,33.27 v2(30.35,31.75)
  Bottom Layer w0.254: CN2.22 41.91,26.04 43.05,24.89 43.05,22.99 42.29,22.23 38.23,22.23 37.59,22.86 37.59,24.51 v2(30.35,31.75)
PH6: length 12.8
  Top Layer w0.254: CN2.23 39.12,24.21 31.62,31.7 31.62,32.35 32.23,32.96
PH7: length 14
  Top Layer w0.254: 32.58,32.61 33.15,32.04 v2(33.15,31.5)
  Bottom Layer w0.254: CN2.24 40.39,24.77 38.48,24.77 33.15,30.1 v2(33.15,31.5)
PJ0: length 24.1
  Top Layer w0.254: v2(32.39,25.02) 32.39,25.38 30.11,27.66
  Bottom Layer w0.254: v2(32.39,25.02) 32.77,24.64 32.77,20.19 35.21,17.74 35.21,13.05 36.2,12.07 40.39,12.07 CN2.32
PJ1: length 20
  Top Layer w0.254: v2(33.4,24.64) 33.4,25.07 U1.69
  Bottom Layer w0.254: CN2.31 38.86,13.08 36.68,13.08 35.85,13.91 35.85,18.5 33.4,20.96 v2(33.4,24.64)
PJ2: length 17
  Top Layer w0.254: 3.68,41.28 4.95,42.55 13.1,42.55 U1.11
PK0: length 27.7
  Top Layer w0.254: 6.22,3.18 10.67,3.18 17.4,9.91 17.4,18.13 ; 21.27,22 17.4,18.13
PK1: length 29.2
  Top Layer w0.254: U1.48 15.83,17.27 15.83,9.36 10.92,4.44 4.95,4.44 4.09,3.58
PK2: length 25
  Top Layer w0.254: U1.47 7.38,9.53 5.59,9.53 4.95,8.89 4.95,6.98 6.22,5.72
PK3: length 29
  Top Layer w0.254: 3.68,5.72 2.29,7.11 2.29,11.3 3.05,12.07 9.27,12.07 20.21,23 U1.46
RST#: length 39.8
  Top Layer w0.254: v2(27.43,28.58) 27.43,26.8 28.34,25.89 ; v2(23.24,28.83) v2(20.96,26.54) 20.83,26.54 ; v2(12.83,9.53) 14.79,11.49 C15.1 14.85,11.87 R1.1
  Bottom Layer w0.254: v2(12.83,9.53) 16.38,9.53 16.89,10.03 19.43,10.03 20.96,11.56 v2(20.96,26.54) ; v2(27.43,28.58) 27.18,28.83 v2(23.24,28.83)
UD+: length 14.7
  Top Layer w0.254: 7.24,55.95 v2(7.24,57.91)
  Bottom Layer w0.254: v2(7.24,57.91) 7.62,57.53 7.62,47.75 8.54,46.83 U5.1
UD-: length 14
  Top Layer w0.254: v2(9.14,57.91) 7.89,56.66 7.89,55.95
  Bottom Layer w0.254: v2(9.14,57.91) 8.13,56.9 8.13,48.51 8.54,48.1 U5.2
XOSC0: length 6.5
  Top Layer w0.254: 24.45,22 25.15,21.31 25.15,19.39 X1.2 24.38,18.62 C13.1
XOSC1: length 7.4
  Top Layer w0.254: C14.1 26.92,18.62 X1.1 26.8,18.75 26.8,21.07 25.16,22.71
$1N922: length 3
  Bottom Layer w0.254: U5.8 15.9,46.83 16.76,45.97 16.76,45.12 C20.2
$1N1167: length 5.2
  Top Layer w0.254: R2.2 34.3,2.53 33.53,3.3 31.11,3.3 U7.2
$1N2381: length 2.7
  Top Layer w0.508: C24.2 33.19,50.56 U8.4
$1N8327: length 2.3
  Top Layer w0.254: U9.2 31.89,4.31 R3.2

## Copper pours and planes (outline as drawn; the poured copper is in the pictures)
GND on Top Layer: -2.16,63.25 50.17,63.25 50.17,-3.56 -2.16,-3.56
GND on Bottom Layer: -5.21,65.91 58.04,65.91 58.04,-5.46 -5.21,-5.46

Small or netless copper shapes (teardrops, artwork), in the pictures only: 279 on Top Layer, 101 on Bottom Layer

## Text on the board
Top Silkscreen Layer: 3.3 | A7 | D0 | D2 | J2 | E2 | E0 | C6 | C4 | A3 | A5 | H6 | A1 | F5 | F0 | F2 | K3 | H1 | K1 | A2 | A4 | D3 | E1 | H0 | H2 | C7 | C5 | A0 | A6 | F6 | F4 | F1 | F3 | K2 | K0 | D1 | E3 | 3.3V | D7 | D5 | E5 | F7 | B4 | G7 | C0 | G5 | G0 | G2 | DIO | E7 | C2 | H4 | B3 | B1 | J1 | CLK | GND | D6 | G6 | C1 | C3 | H5 | H7 | G4 | B2 | B0 | J0 | G1 | G3 | D4 | E4 | B5 | E6 | 5V | 3TX | 1TX | 3RX | 1RX
